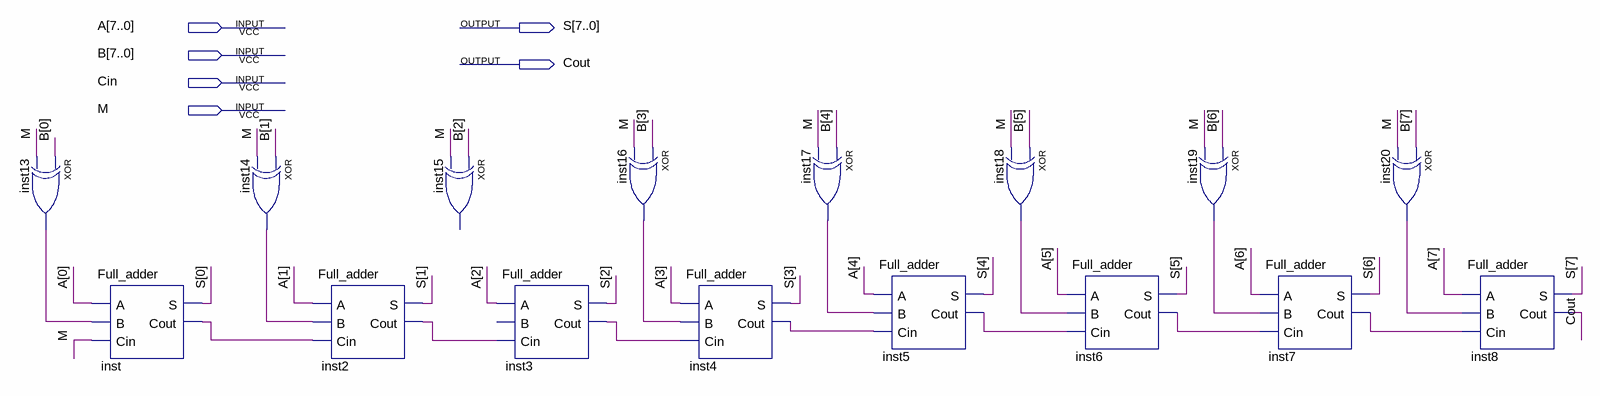
[diagram p0: schematic sheet]
// Quartus schematic sumsub8.bdf as structural Verilog: 16 symbols, 6 pins
module sumsub8 (
  input  [7:0] A,
  input  [7:0] B,
  input  Cin,
  input  M,
  output [7:0] S,
  output Cout
);

  wire inst2_cout, inst3_cout, inst4_cout, inst5_cout, inst6_cout, inst7_cout, inst13_out, inst14_out,
       inst16_out, inst17_out, inst18_out, inst19_out, inst20_out, inst_cout;

  xor inst13 (inst13_out, B[0], M);
  Full_adder inst (.A(A[0]), .B(inst13_out), .Cin(M), .S(S[0]), .Cout(inst_cout));
  xor inst14 (inst14_out, B[1], M);
  Full_adder inst2 (.A(A[1]), .B(inst14_out), .Cin(inst_cout), .S(S[1]), .Cout(inst2_cout));
  // XOR inst15 has open pins: IN1=B[2], IN2=M, OUT=open
  Full_adder inst3 (.A(A[2]), .Cin(inst2_cout), .S(S[2]), .Cout(inst3_cout));  // open: B
  xor inst16 (inst16_out, B[3], M);
  Full_adder inst4 (.A(A[3]), .B(inst16_out), .Cin(inst3_cout), .S(S[3]), .Cout(inst4_cout));
  xor inst17 (inst17_out, B[4], M);
  Full_adder inst5 (.A(A[4]), .B(inst17_out), .Cin(inst4_cout), .S(S[4]), .Cout(inst5_cout));
  xor inst18 (inst18_out, B[5], M);
  Full_adder inst6 (.A(A[5]), .B(inst18_out), .Cin(inst5_cout), .S(S[5]), .Cout(inst6_cout));
  xor inst19 (inst19_out, B[6], M);
  Full_adder inst7 (.A(A[6]), .B(inst19_out), .Cin(inst6_cout), .S(S[6]), .Cout(inst7_cout));
  xor inst20 (inst20_out, B[7], M);
  Full_adder inst8 (.A(A[7]), .B(inst20_out), .Cin(inst7_cout), .S(S[7]), .Cout(Cout));
endmodule
